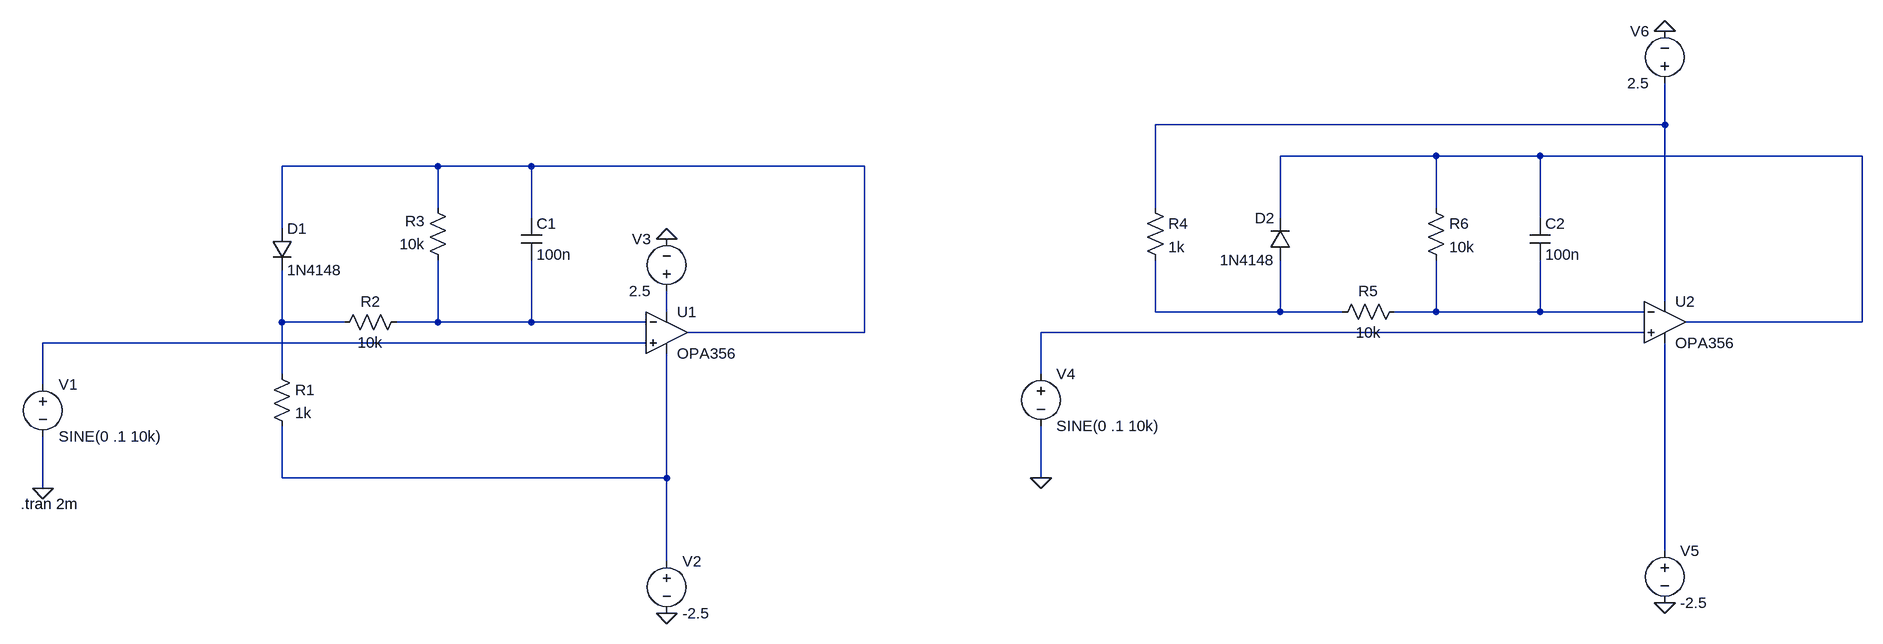
[diagram p0: schematic voltage_offset_circuit.asc]
voltage_offset_circuit.asc, the LTspice schematic file:
Version 4
SHEET 1 2644 680
WIRE 2336 -208 2336 -272
WIRE 2336 -208 1552 -208
WIRE 1984 -160 1744 -160
WIRE 2144 -160 1984 -160
WIRE 2640 -160 2144 -160
WIRE 448 -144 208 -144
WIRE 592 -144 448 -144
WIRE 1104 -144 592 -144
WIRE 448 -80 448 -144
WIRE 1552 -80 1552 -208
WIRE 1984 -80 1984 -160
WIRE 592 -64 592 -144
WIRE 1744 -64 1744 -160
WIRE 2144 -64 2144 -160
WIRE 208 -48 208 -144
WIRE 2336 64 2336 -208
WIRE 800 80 800 48
WIRE 1552 80 1552 0
WIRE 1744 80 1744 0
WIRE 1744 80 1552 80
WIRE 1840 80 1744 80
WIRE 1984 80 1984 0
WIRE 1984 80 1920 80
WIRE 2144 80 2144 0
WIRE 2144 80 1984 80
WIRE 2304 80 2144 80
WIRE 208 96 208 16
WIRE 304 96 208 96
WIRE 448 96 448 0
WIRE 448 96 384 96
WIRE 592 96 592 0
WIRE 592 96 448 96
WIRE 768 96 592 96
WIRE 2640 96 2640 -160
WIRE 2640 96 2368 96
WIRE 1104 112 1104 -144
WIRE 1104 112 832 112
WIRE 2304 112 1376 112
WIRE 768 128 -160 128
WIRE 208 176 208 96
WIRE 1376 176 1376 112
WIRE -160 192 -160 128
WIRE 208 336 208 256
WIRE 800 336 800 144
WIRE 800 336 208 336
WIRE 1376 336 1376 256
WIRE -160 352 -160 272
WIRE 2336 448 2336 128
WIRE 800 464 800 336
FLAG 800 -32 0
FLAG 800 544 0
FLAG -160 352 0
FLAG 2336 -352 0
FLAG 2336 528 0
FLAG 1376 336 0
SYMBOL voltage -160 176 R0
WINDOW 123 0 0 Left 0
WINDOW 39 0 0 Left 0
SYMATTR InstName V1
SYMATTR Value SINE(0 .1 10k)
SYMBOL OPA356 800 48 R0
SYMATTR InstName U1
SYMBOL voltage 800 448 R0
WINDOW 123 0 0 Left 0
WINDOW 39 0 0 Left 0
SYMATTR InstName V2
SYMATTR Value -2.5
SYMBOL voltage 800 64 R180
WINDOW 0 24 96 Left 2
WINDOW 3 24 16 Left 2
WINDOW 123 0 0 Left 0
WINDOW 39 0 0 Left 0
SYMATTR InstName V3
SYMATTR Value 2.5
SYMBOL diode 192 -48 R0
SYMATTR InstName D1
SYMATTR Value 1N4148
SYMBOL res 192 160 R0
SYMATTR InstName R1
SYMATTR Value 1k
SYMBOL res 400 80 R90
WINDOW 0 0 56 VBottom 2
WINDOW 3 32 56 VTop 2
SYMATTR InstName R2
SYMATTR Value 10k
SYMBOL res 464 16 R180
WINDOW 0 36 76 Left 2
WINDOW 3 36 40 Left 2
SYMATTR InstName R3
SYMATTR Value 10k
SYMBOL cap 576 -64 R0
SYMATTR InstName C1
SYMATTR Value 100n
SYMBOL voltage 1376 160 R0
WINDOW 123 0 0 Left 0
WINDOW 39 0 0 Left 0
SYMATTR InstName V4
SYMATTR Value SINE(0 .1 10k)
SYMBOL OPA356 2336 32 R0
SYMATTR InstName U2
SYMBOL voltage 2336 432 R0
WINDOW 123 0 0 Left 0
WINDOW 39 0 0 Left 0
SYMATTR InstName V5
SYMATTR Value -2.5
SYMBOL voltage 2336 -256 R180
WINDOW 0 24 96 Left 2
WINDOW 3 24 16 Left 2
WINDOW 123 0 0 Left 0
WINDOW 39 0 0 Left 0
SYMATTR InstName V6
SYMATTR Value 2.5
SYMBOL diode 1760 0 R180
WINDOW 0 24 64 Left 2
WINDOW 3 24 0 Left 2
SYMATTR InstName D2
SYMATTR Value 1N4148
SYMBOL res 1936 64 R90
WINDOW 0 0 56 VBottom 2
WINDOW 3 32 56 VTop 2
SYMATTR InstName R5
SYMATTR Value 10k
SYMBOL res 1536 -96 R0
SYMATTR InstName R4
SYMATTR Value 1k
SYMBOL res 1968 -96 R0
SYMATTR InstName R6
SYMATTR Value 10k
SYMBOL cap 2128 -64 R0
SYMATTR InstName C2
SYMATTR Value 100n
TEXT -194 376 Left 2 !.tran 2m

The netlist it stands for:
* voltage_offset_circuit.asc
V1 N010 0 SINE(0 .1 10k)
* U1: OPA356 (symbol OPA356 not available, pins judged from their places): In+=N010 In-=N008 V+=N004 V-=N011 OUT=N003
V2 N011 0 -2.5
V3 N004 0 2.5
D1 N003 N007 1N4148
R1 N007 N011 1k
R2 N008 N007 10k
R3 N008 N003 10k
C1 N003 N008 100n
V4 N009 0 SINE(0 .1 10k)
* U2: OPA356 (symbol OPA356 not available, pins judged from their places): In+=N009 In-=N006 V+=N001 V-=N012 OUT=N002
V5 N012 0 -2.5
V6 N001 0 2.5
D2 N005 N002 1N4148
R5 N006 N005 10k
R4 N001 N005 1k
R6 N002 N006 10k
C2 N002 N006 100n
.model D D
.lib standard.dio
.tran 2m
.backanno
.end